# Altium schematic sheet STM32H747.SchDoc: STM32H747
size A3; Author: Silvio Navaretti; CompanyName: Arduino srl; DocumentNumber: ABX00063; Revision: V1.4; SheetNumber: 5; SheetTotal: 8; RevAuthor: Silvio Navaretti
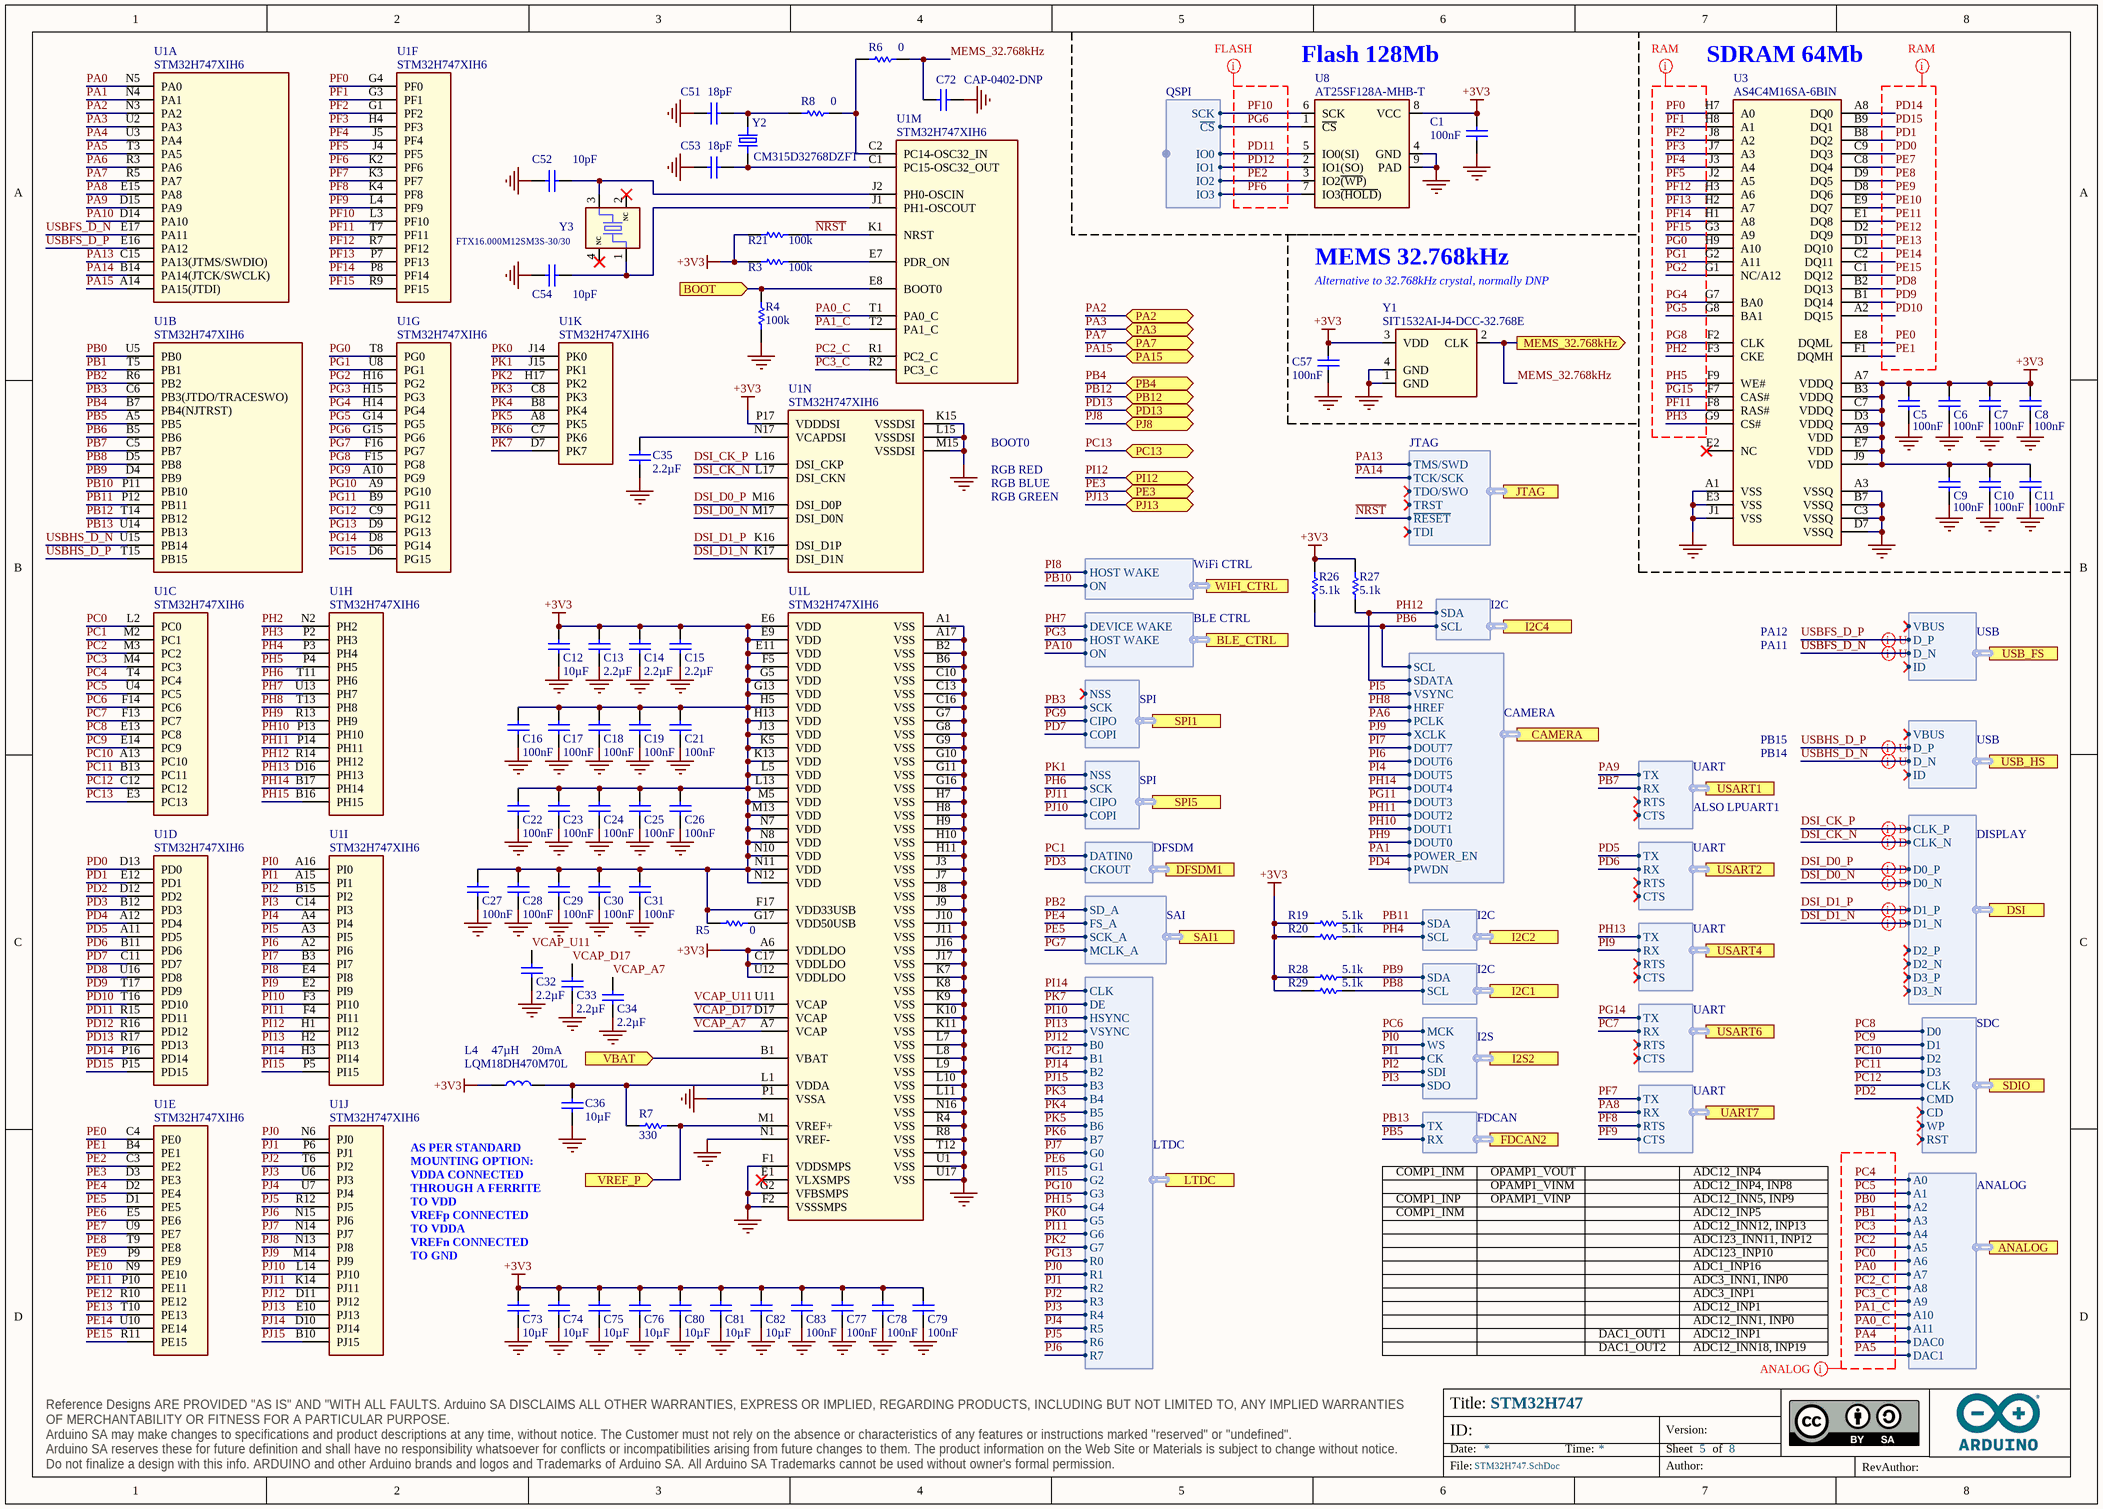
[diagram p0: STM32H747.SchDoc]

## Parts
C1  value 100nF  [CAP-0402]  (hidden comment: GRM155R61H104KE19D)
C5  value 100nF  [CAP-0402]  (hidden comment: GRM155R61H104KE19D)
C6  value 100nF  [CAP-0402]  (hidden comment: GRM155R61H104KE19D)
C7  value 100nF  [CAP-0402]  (hidden comment: GRM155R61H104KE19D)
C8  value 100nF  [CAP-0402]  (hidden comment: GRM155R61H104KE19D)
C9  value 100nF  [CAP-0402]  (hidden comment: GRM155R61H104KE19D)
C10  value 100nF  [CAP-0402]  (hidden comment: GRM155R61H104KE19D)
C11  value 100nF  [CAP-0402]  (hidden comment: GRM155R61H104KE19D)
C12  value 10µF  [CAP-0402]  (hidden comment: GRM155R60J106ME05D)
C13  value 2.2µF  [CAP-0402]  (hidden comment: GRM155R60J225KE95D)
C14  value 2.2µF  [CAP-0402]  (hidden comment: GRM155R60J225KE95D)
C15  value 2.2µF  [CAP-0402]  (hidden comment: GRM155R60J225KE95D)
C16  value 100nF  [CAP-0402]  (hidden comment: GRM155R61H104KE19D)
C17  value 100nF  [CAP-0402]  (hidden comment: GRM155R61H104KE19D)
C18  value 100nF  [CAP-0402]  (hidden comment: GRM155R61H104KE19D)
C19  value 100nF  [CAP-0402]  (hidden comment: GRM155R61H104KE19D)
C21  value 100nF  [CAP-0402]  (hidden comment: GRM155R61H104KE19D)
C22  value 100nF  [CAP-0402]  (hidden comment: GRM155R61H104KE19D)
C23  value 100nF  [CAP-0402]  (hidden comment: GRM155R61H104KE19D)
C24  value 100nF  [CAP-0402]  (hidden comment: GRM155R61H104KE19D)
C25  value 100nF  [CAP-0402]  (hidden comment: GRM155R61H104KE19D)
C26  value 100nF  [CAP-0402]  (hidden comment: GRM155R61H104KE19D)
C27  value 100nF  [CAP-0402]  (hidden comment: GRM155R61H104KE19D)
C28  value 100nF  [CAP-0402]  (hidden comment: GRM155R61H104KE19D)
C29  value 100nF  [CAP-0402]  (hidden comment: GRM155R61H104KE19D)
C30  value 100nF  [CAP-0402]  (hidden comment: GRM155R61H104KE19D)
C31  value 100nF  [CAP-0402]  (hidden comment: GRM155R61H104KE19D)
C32  value 2.2µF  [CAP-0402]  (hidden comment: GRM155R60J225KE95D)
C33  value 2.2µF  [CAP-0402]  (hidden comment: GRM155R60J225KE95D)
C34  value 2.2µF  [CAP-0402]  (hidden comment: GRM155R60J225KE95D)
C35  value 2.2µF  [CAP-0402]  (hidden comment: GRM155R60J225KE95D)
C36  value 10µF  [CAP-0402]  (hidden comment: GRM155R60J106ME05D)
C51  value 18pF  [CAP-0402]  (hidden comment: C0402C180J5GACTU)
C52  value 10pF  [CAP-0402]  (hidden comment: C0402H100J5GACTU)
C53  value 18pF  [CAP-0402]  (hidden comment: C0402C180J5GACTU)
C54  value 10pF  [CAP-0402]  (hidden comment: C0402H100J5GACTU)
C57  value 100nF  [CAP-0402]  (hidden comment: GRM155R61H104KE19D)
C72  CAP-0402-DNP  [CAP-0402]
C73  value 10µF  [CAP-0402]  (hidden comment: GRM155R60J106ME05D)
C74  value 10µF  [CAP-0402]  (hidden comment: GRM155R60J106ME05D)
C75  value 10µF  [CAP-0402]  (hidden comment: GRM155R60J106ME05D)
C76  value 10µF  [CAP-0402]  (hidden comment: GRM155R60J106ME05D)
C77  value 100nF  [CAP-0402]  (hidden comment: GRM155R61H104KE19D)
C78  value 100nF  [CAP-0402]  (hidden comment: GRM155R61H104KE19D)
C79  value 100nF  [CAP-0402]  (hidden comment: GRM155R61H104KE19D)
C80  value 10µF  [CAP-0402]  (hidden comment: GRM155R60J106ME05D)
C81  value 10µF  [CAP-0402]  (hidden comment: GRM155R60J106ME05D)
C82  value 10µF  [CAP-0402]  (hidden comment: GRM155R60J106ME05D)
C83  value 100nF  [CAP-0402]  (hidden comment: GRM155R61H104KE19D)
L4  LQM18DH470M70L  Current: 20mA  Inductance: 47µH  [L-0603]
R3  value 100k  [RES-0402]  (hidden comment: CRCW0402100KFKEDC)
R4  value 100k  [RES-0402]  (hidden comment: CRCW0402100KFKEDC)
R5  value 0  [RES-0402]  (hidden comment: CRCW04020000Z0EDC)
R6  value 0  [RES-0402]  (hidden comment: CRCW04020000Z0EDC)
R7  value 330  [RES-0402]  (hidden comment: CRCW0402330RJNED)
R8  value 0  [RES-0402]  (hidden comment: CRCW04020000Z0EDC)
R19  value 5.1k  [RES-0402]  (hidden comment: RC0402FR-075K1L)
R20  value 5.1k  [RES-0402]  (hidden comment: RC0402FR-075K1L)
R21  value 100k  [RES-0402]  (hidden comment: CRCW0402100KFKEDC)
R26  value 5.1k  [RES-0402]  (hidden comment: RC0402FR-075K1L)
R27  value 5.1k  [RES-0402]  (hidden comment: RC0402FR-075K1L)
R28  value 5.1k  [RES-0402]  (hidden comment: RC0402FR-075K1L)
R29  value 5.1k  [RES-0402]  (hidden comment: RC0402FR-075K1L)
U1  STM32H747XIH6  [STM32H747XIH6-Footprint-1]  (parts A,B,C,D,E,F,G,H,I,J,K,L,M,N of 14)
U3  AS4C4M16SA-6BIN  [AS4C4M16SA-7BCN-Footprint-1]
U8  AT25SF128A-MHB-T  [PSON127P600X60_HS-9N]
Y1  SIT1532AI-J4-DCC-32.768E  [SiT1532AI-J4-DCC-32.768E-Footprint-1]
Y2  CM315D32768DZFT  [ABS07]
Y3  FTX16.000M12SM3S-30/30  [CRYSTAL_3.2x2.5mm_16MHz]

## Ports
ANALOG (harness ANALOG), BLE_CTRL (harness BLE CTRL), BOOT (in), CAMERA (harness CAMERA), DFSDM1 (harness DFSDM), DSI (harness DISPLAY), FDCAN2 (harness FDCAN), I2C1 (harness I2C), I2C2 (harness I2C), I2C4 (harness I2C), I2S2 (harness I2S), JTAG (harness JTAG), LTDC (harness LTDC), MEMS_32.768kHz (out), PA2 (bidir), PA3 (bidir), PA7 (bidir), PA15 (bidir), PB4 (bidir), PB12 (bidir), PC13 (bidir), PD13 (bidir), PE3 (bidir), PI12 (bidir), PJ8 (bidir), PJ13 (bidir), SAI1 (harness SAI), SDIO (harness SDC), SPI1 (harness SPI), SPI5 (harness SPI), UART7 (harness UART), USART1 (harness UART), USART2 (harness UART), USART4 (harness UART), USART6 (harness UART), USB_FS (harness USB), USB_HS (harness USB), VBAT (in), VREF_P (in), WIFI_CTRL (harness WiFi CTRL)

## Harnesses
DISPLAY: CLK_N, CLK_P, D0_N, D0_P, D1_N, D1_P, D2_N, D2_P, D3_N, D3_P
SDC: CLK, CMD, D0, D1, D2, D3, CD, WP, RST
USB: VBUS, D_P, D_N, ID
UART: RX, TX, RTS, CTS
I2C: SDA, SCL
ANALOG: A0, A1, A2, A3, A7, A6, A5, A4, A8, A9, A10, A11, DAC0, DAC1
FDCAN: RX, TX
LTDC: B0, B1, B2, B3, B4, B5, B6, B7, CLK, DE, G0, G1, G2, G3, G4, G5, G6, G7, HSYNC, R0, R1, R2, R3, R4, R5, R6, R7, VSYNC
SAI: SD_A, FS_A, SCK_A, MCLK_A
I2S: CK, SDI, SDO, WS, MCK
DFSDM: DATIN0, CKOUT
CAMERA: SCL, SDATA, VSYNC, HREF, PCLK, XCLK, DOUT7, DOUT6, DOUT5, DOUT4, DOUT3, DOUT2, DOUT1, DOUT0, POWER_EN, PWDN
SPI: NSS, SCK, CIPO, COPI
BLE CTRL: HOST WAKE, DEVICE WAKE, ON
WiFi CTRL: HOST WAKE, ON
QSPI: SCK, ~{CS}, IO0, IO1, IO2, IO3
JTAG: ~{RESET}, TCK/SCK, TDI, TDO/SWO, TMS/SWD, TRST

## Nets
+3V3: C1.2 C5.2 C6.2 C7.2 C8.2 C9.2 C10.2 C11.2 C12.2 C13.2 C14.2 C15.2 C16.2 C17.2 C18.2 C19.2 C21.2 C22.2 C23.2 C24.2 C25.2 C26.2 C27.2 C28.2 C29.2 C30.2 C31.2 C57.2 C73.2 C74.2 C75.2 C76.2 C77.2 C78.2 C79.2 C80.2 C81.2 C82.2 C83.2 L4.1 R3.1 R5.1 R19.2 R20.2 R21.1 R26.2 R27.2 R28.2 R29.2 U1.A6(VDDLDO) U1.C17(VDDLDO) U1.E6(VDD) U1.E9(VDD) U1.E11(VDD) U1.F5(VDD) U1.F17(VDD33USB) U1.G5(VDD) U1.G13(VDD) U1.H5(VDD) U1.H13(VDD) U1.J13(VDD) U1.K5(VDD) U1.K13(VDD) U1.L5(VDD) U1.L13(VDD) U1.M5(VDD) U1.M13(VDD) U1.N7(VDD) U1.N8(VDD) U1.N10(VDD) U1.N11(VDD) U1.N12(VDD) U1.P17(VDDDSI) U1.U12(VDDLDO) U3.A7(VDDQ) U3.A9(VDD) U3.B3(VDDQ) U3.C7(VDDQ) U3.D3(VDDQ) U3.E7(VDD) U3.J9(VDD) U8.8(VCC) Y1.3(VDD)
GND: C1.1 C5.1 C6.1 C7.1 C8.1 C9.1 C10.1 C11.1 C12.1 C13.1 C14.1 C15.1 C16.1 C17.1 C18.1 C19.1 C21.1 C22.1 C23.1 C24.1 C25.1 C26.1 C27.1 C28.1 C29.1 C30.1 C31.1 C32.1 C33.1 C34.1 C35.1 C36.1 C51.2 C52.2 C53.2 C54.2 C57.1 C72.2 C73.1 C74.1 C75.1 C76.1 C77.1 C78.1 C79.1 C80.1 C81.1 C82.1 C83.1 R4.2 U1.A1(VSS) U1.A17(VSS) U1.B2(VSS) U1.B6(VSS) U1.C10(VSS) U1.C13(VSS) U1.C16(VSS) U1.F1(VDDSMPS) U1.F2(VSSSMPS) U1.G2(VFBSMPS) U1.G7(VSS) U1.G8(VSS) U1.G9(VSS) U1.G10(VSS) U1.G11(VSS) U1.G16(VSS) U1.H7(VSS) U1.H8(VSS) U1.H9(VSS) U1.H10(VSS) U1.H11(VSS) U1.J3(VSS) U1.J7(VSS) U1.J8(VSS) U1.J9(VSS) U1.J10(VSS) U1.J11(VSS) U1.J16(VSS) U1.J17(VSS) U1.K7(VSS) U1.K8(VSS) U1.K9(VSS) U1.K10(VSS) U1.K11(VSS) U1.K15(VSSDSI) U1.L7(VSS) U1.L8(VSS) U1.L9(VSS) U1.L10(VSS) U1.L11(VSS) U1.L15(VSSDSI) U1.M15(VSSDSI) U1.N1(VREF-) U1.N16(VSS) U1.P1(VSSA) U1.R4(VSS) U1.R8(VSS) U1.T12(VSS) U1.U1(VSS) U1.U17(VSS) U3.A1(VSS) U3.A3(VSSQ) U3.B7(VSSQ) U3.C3(VSSQ) U3.D7(VSSQ) U3.E3(VSS) U3.J1(VSS) U8.4(GND) U8.9(PAD) Y1.1(GND) Y1.4(GND)
BOOT: R4.1 U1.E8(BOOT0) ; port BOOT
DSI_CK_N: U1.L17(DSI_CKN) ; port DSI.CLK_N
DSI_CK_P: U1.L16(DSI_CKP) ; port DSI.CLK_P
DSI_D0_N: U1.M17(DSI_D0N) ; port DSI.D0_N
DSI_D0_P: U1.M16(DSI_D0P) ; port DSI.D0_P
DSI_D1_N: U1.K17(DSI_D1N) ; port DSI.D1_N
DSI_D1_P: U1.K16(DSI_D1P) ; port DSI.D1_P
MEMS_32.768kHz: C72.1 R6.2 Y1.2(CLK) ; port MEMS_32.768kHz
~{NRST}: R21.2 U1.K1(NRST) ; port JTAG.~{RESET}
PA0: U1.N5(PA0) ; port ANALOG.A7
PA0_C: U1.T1(PA0_C) ; port ANALOG.A11
PA1: U1.N4(PA1) ; port CAMERA.POWER_EN
PA1_C: U1.T2(PA1_C) ; port ANALOG.A10
PA2: U1.N3(PA2) ; port PA2
PA3: U1.U2(PA3) ; port PA3
PA4: U1.U3(PA4) ; port ANALOG.DAC0
PA5: U1.T3(PA5) ; port ANALOG.DAC1
PA6: U1.R3(PA6) ; port CAMERA.PCLK
PA7: U1.R5(PA7) ; port PA7
PA8: U1.E15(PA8) ; port UART7.RX
PA9: U1.D15(PA9) ; port USART1.TX
PA10: U1.D14(PA10) ; port BLE_CTRL.ON
PA13: U1.C15(PA13(JTMS/SWDIO)) ; port JTAG.TMS/SWD
PA14: U1.B14(PA14(JTCK/SWCLK)) ; port JTAG.TCK/SCK
PA15: U1.A14(PA15(JTDI)) ; port PA15
PB0: U1.U5(PB0) ; port ANALOG.A2
PB1: U1.T5(PB1) ; port ANALOG.A3
PB2: U1.R6(PB2) ; port SAI1.SD_A
PB3: U1.C6(PB3(JTDO/TRACESWO)) ; port SPI1.SCK
PB4: U1.B7(PB4(NJTRST)) ; port PB4
PB5: U1.A5(PB5) ; port FDCAN2.RX
PB6: R26.1 U1.B5(PB6) ; port I2C4.SCL, port CAMERA.SCL
PB7: U1.C5(PB7) ; port USART1.RX
PB8: R29.1 U1.D5(PB8) ; port I2C1.SCL
PB9: R28.1 U1.D4(PB9) ; port I2C1.SDA
PB10: U1.P11(PB10) ; port WIFI_CTRL.ON
PB11: R19.1 U1.P12(PB11) ; port I2C2.SDA
PB12: U1.T14(PB12) ; port PB12
PB13: U1.U14(PB13) ; port FDCAN2.TX
PC0: U1.L2(PC0) ; port ANALOG.A6
PC1: U1.M2(PC1) ; port DFSDM1.DATIN0
PC2: U1.M3(PC2) ; port ANALOG.A5
PC2_C: U1.R1(PC2_C) ; port ANALOG.A8
PC3: U1.M4(PC3) ; port ANALOG.A4
PC3_C: U1.R2(PC3_C) ; port ANALOG.A9
PC4: U1.T4(PC4) ; port ANALOG.A0
PC5: U1.U4(PC5) ; port ANALOG.A1
PC6: U1.F14(PC6) ; port I2S2.MCK
PC7: U1.F13(PC7) ; port USART6.RX
PC8: U1.E13(PC8) ; port SDIO.D0
PC9: U1.E14(PC9) ; port SDIO.D1
PC10: U1.A13(PC10) ; port SDIO.D2
PC11: U1.B13(PC11) ; port SDIO.D3
PC12: U1.C12(PC12) ; port SDIO.CLK
PC13: U1.E3(PC13) ; port PC13
PD0: U1.D13(PD0) U3.C9(DQ3)
PD1: U1.E12(PD1) U3.B8(DQ2)
PD2: U1.D12(PD2) ; port SDIO.CMD
PD3: U1.B12(PD3) ; port DFSDM1.CKOUT
PD4: U1.A12(PD4) ; port CAMERA.PWDN
PD5: U1.A11(PD5) ; port USART2.TX
PD6: U1.B11(PD6) ; port USART2.RX
PD7: U1.C11(PD7) ; port SPI1.COPI
PD8: U1.U16(PD8) U3.B2(DQ13)
PD9: U1.T17(PD9) U3.B1(DQ14)
PD10: U1.T16(PD10) U3.A2(DQ15)
PD11: U1.R15(PD11) U8.5(IO0(SI)) ; harness QSPI.IO0
PD12: U1.R16(PD12) U8.2(IO1(SO)) ; harness QSPI.IO1
PD13: U1.R17(PD13) ; port PD13
PD14: U1.P16(PD14) U3.A8(DQ0)
PD15: U1.P15(PD15) U3.B9(DQ1)
PE0: U1.C4(PE0) U3.E8(DQML)
PE1: U1.B4(PE1) U3.F1(DQMH)
PE2: U1.C3(PE2) U8.3(IO2~{(WP})) ; harness QSPI.IO2
PE3: U1.D3(PE3) ; port PE3
PE4: U1.D2(PE4) ; port SAI1.FS_A
PE5: U1.D1(PE5) ; port SAI1.SCK_A
PE6: U1.E5(PE6) ; port LTDC.G1
PE7: U1.U9(PE7) U3.C8(DQ4)
PE8: U1.T9(PE8) U3.D9(DQ5)
PE9: U1.P9(PE9) U3.D8(DQ6)
PE10: U1.N9(PE10) U3.E9(DQ7)
PE11: U1.P10(PE11) U3.E1(DQ8)
PE12: U1.R10(PE12) U3.D2(DQ9)
PE13: U1.T10(PE13) U3.D1(DQ10)
PE14: U1.U10(PE14) U3.C2(DQ11)
PE15: U1.R11(PE15) U3.C1(DQ12)
PF0: U1.G4(PF0) U3.H7(A0)
PF1: U1.G3(PF1) U3.H8(A1)
PF2: U1.G1(PF2) U3.J8(A2)
PF3: U1.H4(PF3) U3.J7(A3)
PF4: U1.J5(PF4) U3.J3(A4)
PF5: U1.J4(PF5) U3.J2(A5)
PF6: U1.K2(PF6) U8.7(IO3~{(HOLD})) ; harness QSPI.IO3
PF7: U1.K3(PF7) ; port UART7.TX
PF8: U1.K4(PF8) ; port UART7.RTS
PF9: U1.L4(PF9) ; port UART7.CTS
PF10: U1.L3(PF10) U8.6(SCK) ; harness QSPI.SCK
PF11: U1.T7(PF11) U3.F8(RAS#)
PF12: U1.R7(PF12) U3.H3(A6)
PF13: U1.P7(PF13) U3.H2(A7)
PF14: U1.P8(PF14) U3.H1(A8)
PF15: U1.R9(PF15) U3.G3(A9)
PG0: U1.T8(PG0) U3.H9(A10)
PG1: U1.U8(PG1) U3.G2(A11)
PG2: U1.H16(PG2) U3.G1(NC/A12)
PG3: U1.H15(PG3) ; port BLE_CTRL.HOST WAKE
PG4: U1.H14(PG4) U3.G7(BA0)
PG5: U1.G14(PG5) U3.G8(BA1)
PG6: U1.G15(PG6) U8.1(~{CS}) ; harness QSPI.~{CS}
PG7: U1.F16(PG7) ; port SAI1.MCLK_A
PG8: U1.F15(PG8) U3.F2(CLK)
PG9: U1.A10(PG9) ; port SPI1.CIPO
PG10: U1.A9(PG10) ; port LTDC.G3
PG11: U1.B9(PG11) ; port CAMERA.DOUT3
PG12: U1.C9(PG12) ; port LTDC.B1
PG13: U1.D9(PG13) ; port LTDC.R0
PG14: U1.D8(PG14) ; port USART6.TX
PG15: U1.D6(PG15) U3.F7(CAS#)
PH2: U1.N2(PH2) U3.F3(CKE)
PH3: U1.P2(PH3) U3.G9(CS#)
PH4: R20.1 U1.P3(PH4) ; port I2C2.SCL
PH5: U1.P4(PH5) U3.F9(WE#)
PH6: U1.T11(PH6) ; port SPI5.SCK
PH7: U1.U13(PH7) ; port BLE_CTRL.DEVICE WAKE
PH8: U1.T13(PH8) ; port CAMERA.HREF
PH9: U1.R13(PH9) ; port CAMERA.DOUT0
PH10: U1.P13(PH10) ; port CAMERA.DOUT1
PH11: U1.P14(PH11) ; port CAMERA.DOUT2
PH12: R27.1 U1.R14(PH12) ; port I2C4.SDA, port CAMERA.SDATA
PH13: U1.D16(PH13) ; port USART4.TX
PH14: U1.B17(PH14) ; port CAMERA.DOUT4
PH15: U1.B16(PH15) ; port LTDC.G4
PI0: U1.A16(PI0) ; port I2S2.WS
PI1: U1.A15(PI1) ; port I2S2.CK
PI2: U1.B15(PI2) ; port I2S2.SDI
PI3: U1.C14(PI3) ; port I2S2.SDO
PI4: U1.A4(PI4) ; port CAMERA.DOUT5
PI5: U1.A3(PI5) ; port CAMERA.VSYNC
PI6: U1.A2(PI6) ; port CAMERA.DOUT6
PI7: U1.B3(PI7) ; port CAMERA.DOUT7
PI8: U1.E4(PI8) ; port WIFI_CTRL.HOST WAKE
PI9: U1.E2(PI9) ; port USART4.RX
PI10: U1.F3(PI10) ; port LTDC.HSYNC
PI11: U1.F4(PI11) ; port LTDC.G6
PI12: U1.H1(PI12) ; port PI12
PI13: U1.H2(PI13) ; port LTDC.VSYNC
PI14: U1.H3(PI14) ; port LTDC.CLK
PI15: U1.P5(PI15) ; port LTDC.G2
PJ0: U1.N6(PJ0) ; port LTDC.R1
PJ1: U1.P6(PJ1) ; port LTDC.R2
PJ2: U1.T6(PJ2) ; port LTDC.R3
PJ3: U1.U6(PJ3) ; port LTDC.R4
PJ4: U1.U7(PJ4) ; port LTDC.R5
PJ5: U1.R12(PJ5) ; port LTDC.R6
PJ6: U1.N15(PJ6) ; port LTDC.R7
PJ7: U1.N14(PJ7) ; port LTDC.G0
PJ8: U1.N13(PJ8) ; port PJ8
PJ9: U1.M14(PJ9) ; port CAMERA.XCLK
PJ10: U1.L14(PJ10) ; port SPI5.COPI
PJ11: U1.K14(PJ11) ; port SPI5.CIPO
PJ12: U1.D11(PJ12) ; port LTDC.B0
PJ13: U1.E10(PJ13) ; port PJ13
PJ14: U1.D10(PJ14) ; port LTDC.B2
PJ15: U1.B10(PJ15) ; port LTDC.B3
PK0: U1.J14(PK0) ; port LTDC.G5
PK1: U1.J15(PK1) ; port SPI5.NSS
PK2: U1.H17(PK2) ; port LTDC.G7
PK3: U1.C8(PK3) ; port LTDC.B4
PK4: U1.B8(PK4) ; port LTDC.B5
PK5: U1.A8(PK5) ; port LTDC.B6
PK6: U1.C7(PK6) ; port LTDC.B7
PK7: U1.D7(PK7) ; port LTDC.DE
USBFS_D_N: U1.E17(PA11) ; port USB_FS.D_N
USBFS_D_P: U1.E16(PA12) ; port USB_FS.D_P
USBHS_D_N: U1.U15(PB14) ; port USB_HS.D_N
USBHS_D_P: U1.T15(PB15) ; port USB_HS.D_P
VBAT: U1.B1(VBAT) ; port VBAT
VCAP_A7: C34.2 U1.A7(VCAP)
VCAP_D17: C33.2 U1.D17(VCAP)
VCAP_U11: C32.2 U1.U11(VCAP)
VREF_P: R7.1 U1.M1(VREF+) ; port VREF_P
NetC35_2: C35.2 U1.N17(VCAPDSI)
NetC36_2: C36.2 L4.2 R7.2 U1.L1(VDDA)
NetC51_1: C51.1 R8.1 Y2.2
NetC52_1: C52.1 U1.J2(PH0-OSCIN) Y3.3
NetC53_1: C53.1 U1.C1(PC15-OSC32_OUT) Y2.1
NetC54_1: C54.1 U1.J1(PH1-OSCOUT) Y3.1
NetR3_2: R3.2 U1.E7(PDR_ON)
NetR5_2: R5.2 U1.G17(VDD50USB)
NetR6_1: R6.1 R8.2 U1.C2(PC14-OSC32_IN)

Not connected (* = marked no-connect by the designer): U1 E1(VLXSMPS)*; U3 E2(NC)*; Y3 2(NC)* 4(NC)*

## Layout directives
differential pair; differential pair class USB: USBFS_D_N, USBFS_D_P, USBHS_D_N, USBHS_D_P
differential pair; differential pair class DSI: DSI_CK_N, DSI_CK_P, DSI_D0_N, DSI_D0_P, DSI_D1_N, DSI_D1_P
net class RAM: PD0, PD1, PD8, PD9, PD10, PD14, PD15, PE0, PE1, PE7, PE8, PE9, PE10, PE11, PE12, PE13, PE14, PE15, PF0, PF1, PF2, PF3, PF4, PF5, PF11, PF12, PF13, PF14, PF15, PG0, PG1, PG2, PG4, PG5, PG8, PG15, PH2, PH3, PH5
net class ANALOG: PA0, PA0_C, PA1_C, PA4, PA5, PB0, PB1, PC0, PC2, PC2_C, PC3, PC3_C, PC4, PC5
net class FLASH: PD11, PD12, PE2, PF6, PF10, PG6

## Notes on the sheet
- Flash 128Mb
- (near U3) SDRAM 64Mb
- MEMS 32.768kHz
- Alternative to 32.768kHz crystal, normally DNP
- BOOT0
- RGB RED
- RGB BLUE
- RGB GREEN
- PA12
- PA11
- PB15
- PB14
- ALSO LPUART1
- COMP1_INM
- OPAMP1_VOUT
- OPAMP1_VINM
- ADC12_INP4
- ADC12_INP4, INP8
- AS PER STANDARD MOUNTING OPTION:
  VDDA CONNECTED THROUGH A FERRITE TO VDD
  VREFp CONNECTED TO VDDA
  VREFn CONNECTED TO GND
- COMP1_INP
- OPAMP1_VINP
- ADC12_INN5, INP9
- ADC12_INP5
- ADC12_INN12, INP13
- ADC123_INN11, INP12
- ADC123_INP10
- ADC3_INN1, INP0
- ADC3_INP1
- ADC12_INP1
- ADC12_INN1, INP0
- ADC1_INP16
- DAC1_OUT2
- DAC1_OUT1
- ADC12_INN18, INP19
- Title:
- ID:
- Date:
- Time:
- Version:
- Sheet
- of
- RevAuthor:
- Reference Designs ARE PROVIDED "AS IS" AND "WITH ALL FAULTS. Arduino SA DISCLAIMS ALL OTHER WARRANTIES, EXPRESS OR IMPLIED, REGARDING PRODUCTS, INCLUDING BUT NOT LIMITED TO, ANY IMPLIED WARRANTIES OF MERCHANTABILITY OR FITNESS FOR A PARTICULAR PURPOSE.
  Arduino SA may make changes to specifications and product descriptions at any time, without notice. The Customer must not rely on the absence or characteristics of any features or instructions marked "reserved" or "undefined".
  Arduino SA reserves these for future definition and shall have no responsibility whatsoever for conflicts or incompatibilities arising from future changes to them. The product information on the Web Site or Materials is subject to change without notice.
  Do not finalize a design with this info. ARDUINO and other Arduino brands and logos and Trademarks of Arduino SA. All Arduino SA Trademarks cannot be used without owner's formal permission.
- File:
- Author:

## Library data of the parts
C1 C5-C11 C16-C19 C21-C31 C57 C77-C79 C83 = C0015-A.14: CAP CHIP 0402 100nF 10% 50V X5R; Manufacturer: Murata; Code Arduino: A5141; Voltage: 50V; Dielectric: X5R; Part Number: GRM155R61H104KE19D; Tolerance: 10%; Case Code (Imperial): 0402; Technology: Ceramic
C12 C36 C73-C76 C80-C82 = C0091-A.13: CAP CHIP 0402 10uF 20% X5R 6.3V; Manufacturer: Murata; Code Arduino: C0091; Part Number: GRM155R60J106ME05D; Voltage: 6.3V; Dielectric: X5R; Tolerance: 20%; Case Code (Imperial): 0402; Technology: Ceramic
C13-C15 C32-C35 = C0031-A.14: CAP CHIP 0402 2.2uF 10% 6.3V X5R; Manufacturer: Murata; Code Arduino: A5529; Voltage: 6.3V; Part Number: GRM155R60J225KE95D; Dielectric: X5R; Case Code (Imperial): 0402; Tolerance: 10%; Technology: Ceramic
C51 C53 = C0026-A.14: CAP CHIP 0402 18pF 5% C0G 50V; Manufacturer: KEMET; Code Arduino: 2320; Part Number: C0402C180J5GACTU; Tolerance: 5%; Voltage: 50V; Dielectric: C0G; Case Code (Imperial): 0402; Technology: Ceramic
C52 C54 = C0006-A.14: CAP CHIP 0402 10pF 5% 50V C0G; Manufacturer: KEMET; Code Arduino: 3382; Part Number: C0402H100J5GACTU; Case Code (Imperial): 0402; Dielectric: C0G; Tolerance: 5%; Voltage: 50V; Technology: Ceramic
C72 = UT0021-A.3: DNP CAP 0402; Package: 0402; Part Number: DNP
L4 = I0063-A.3: IND 47uH 20% Isat 20mA f 10MHz 0603; Manufacturer: Murata; Series Resistance: 2.55; Max DC Current: 180mA; Code Arduino: I0063; Part Number: LQM18DH470M70L; Tolerance: 20%; DC Resistance (DCR): 2.55; Frequency: 10MHz; Case Code (Imperial): 0603
R3 R4 R21 = R0001-A.23: RES CHIP 0402 100k 1% 1/16W; Manufacturer: Vishay; Power: 62.5mW; Code Arduino: 0134; Temperature coefficient: 100ppm; Part Number: CRCW0402100KFKEDC; Tolerance: 1%; Case Code (Imperial): 0402; Technology: Thick film
R5 = R0000-A.23: RES CHIP 0402 0R 1/16W; Manufacturer: Vishay; Code Arduino: 0039; Tolerance: 0%; Power: 62.5mW; Temperature coefficient: 0ppm; Part Number: CRCW04020000Z0EDC; Case Code (Imperial): 0402; Technology: Thick film
R6 R8 = R0000-A.23: RES CHIP 0402 0R 1/16W; Manufacturer: Vishay; Power: 62.5mW; Tolerance: 0%; Code Arduino: 0039; Temperature coefficient: 0ppm; Part Number: CRCW04020000Z0EDC; Case Code (Imperial): 0402; Technology: Thick film
R7 = R0017-A.23: RES CHIP 0402 330R 5% 1/16W; Manufacturer: Vishay; Code Arduino: 2229; Power: 62.5mW; Temperature coefficient: 200ppm; Part Number: CRCW0402330RJNED; Case Code (Imperial): 0402; Tolerance: 5%; Technology: Thick film
R19 R20 R26-R29 = R0210-A.18: RES CHIP 0402 5k1 1% 1/16W; Manufacturer: YAGEO; Power: 63mW; Code Arduino: R0210; Temperature coefficient: 100ppm; Tolerance: 1%; Part Number: RC0402FR-075K1L; Case Code (Imperial): 0402; Technology: Thick film
U1 = U0020-A.8: IC MCU Cortex M7 + Cortex M4; Manufacturer: ST Microelectronics; Code Arduino: A5524; Part Number: STM32H747XIH6
U3 = U0122-A.4: IC SDRAM 64 Mb PC133 SDR; Manufacturer: Alliance Memory; Code Arduino: U0122; Part Number: AS4C4M16SA-6BIN
U8 = U0197-A.9: IC FLASH 128MB 6DFN 3V; Manufacturer: Adesto Technologies; Code Arduino: U0197; Part Number: AT25SF128A-MHB-T
Y1 = X0002-A.6: MEMS OSC XO 32.7680KHZ LVCMOS; Manufacturer: SiTIME; Frequency: 32.768kHz; Min Supply Voltage: 1.5V; Current Rating: 1.35uA; Load Capacitance: 10pF; Max Supply Current: 1.4uA; Code Arduino: X0002; Frequency Stability: 100ppm; Max Duty Cycle: 52%; Max Supply Voltage: 3.63V; Min Operating Temperature: -40°C; Part Number: SIT1532AI-J4-DCC-32.768E; Max Operating Temperature: 85°C
Y2 = X0003-A.5: CRYSTAL 32.768kHz 20ppm 12.5pF SMD 1.6x0.9mm; Manufacturer: Citizen FineDevice; Series Resistance: 70kR; Code Arduino: 0213; Frequency Stability: 0.12%; Max Operating Temperature: 85°C; Min Operating Temperature: -40°C; Load Capacitance: 12.5pF; Frequency: 32.768kHz; Radiation Hardening: No; Part Number: CM315D32768DZFT; Frequency Tolerance: 20ppm
Y3 = X0019-A.12: CRYSTAL 16.0000MHz 12pF SMD; Manufacturer: Fronter Electronics; Frequency: 16MHz; Code Arduino: 0395; Part Number: FTX16.000M12SM3S-30/30